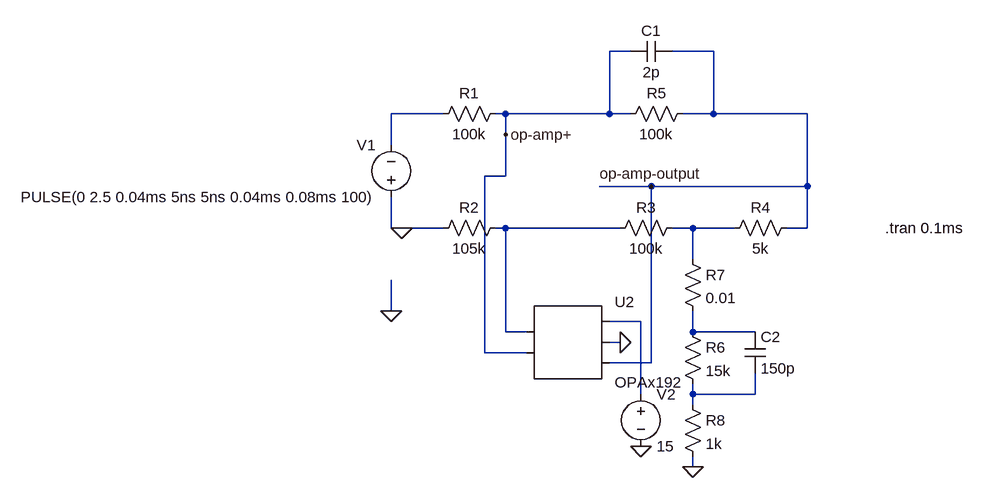
[diagram p0: schematic howland current pump.asc]
howland current pump.asc, the LTspice schematic file:
Version 4
SHEET 1 1072 864
WIRE 448 160 416 160
WIRE 576 160 512 160
WIRE 160 256 80 256
WIRE 256 256 240 256
WIRE 416 256 416 160
WIRE 416 256 256 256
WIRE 448 256 416 256
WIRE 576 256 576 160
WIRE 576 256 528 256
WIRE 720 256 576 256
WIRE 256 288 256 256
WIRE 80 304 80 256
WIRE 256 352 256 288
WIRE 256 352 224 352
WIRE 480 368 400 368
WIRE 720 368 720 256
WIRE 720 368 480 368
WIRE 80 432 80 384
WIRE 96 432 80 432
WIRE 160 432 96 432
WIRE 256 432 240 432
WIRE 432 432 256 432
WIRE 544 432 512 432
WIRE 608 432 544 432
WIRE 720 432 720 368
WIRE 720 432 688 432
WIRE 544 480 544 432
WIRE 80 560 80 512
WIRE 464 576 416 576
WIRE 256 592 256 432
WIRE 288 592 256 592
WIRE 544 592 544 560
WIRE 640 592 544 592
WIRE 432 608 416 608
WIRE 224 624 224 352
WIRE 288 624 224 624
WIRE 480 640 480 368
WIRE 480 640 416 640
WIRE 464 688 464 576
WIRE 544 688 544 672
WIRE 640 688 640 656
WIRE 640 688 544 688
WIRE 544 704 544 688
WIRE 544 800 544 784
FLAG 80 560 0
FLAG 464 768 0
FLAG 256 288 op-amp+
FLAG 480 368 op-amp-output
FLAG 432 608 0
FLAG 544 800 0
FLAG 96 432 0
SYMBOL Res 256 240 R90
WINDOW 0 0 56 VBottom 2
WINDOW 3 32 56 VTop 2
SYMATTR InstName R1
SYMATTR Value 100k
SYMBOL Res 256 416 R90
WINDOW 0 0 56 VBottom 2
WINDOW 3 32 56 VTop 2
SYMATTR InstName R2
SYMATTR Value 105k
SYMBOL Res 528 416 R90
WINDOW 0 0 56 VBottom 2
WINDOW 3 32 56 VTop 2
SYMATTR InstName R3
SYMATTR Value 100k
SYMBOL Res 704 416 R90
WINDOW 0 0 56 VBottom 2
WINDOW 3 32 56 VTop 2
SYMATTR InstName R4
SYMATTR Value 5k
SYMBOL Res 544 240 R90
WINDOW 0 0 56 VBottom 2
WINDOW 3 32 56 VTop 2
SYMATTR InstName R5
SYMATTR Value 100k
SYMBOL Cap 512 144 R90
WINDOW 0 0 32 VBottom 2
WINDOW 3 32 32 VTop 2
SYMATTR InstName C1
SYMATTR Value 2p
SYMBOL Res 528 576 R0
SYMATTR InstName R6
SYMATTR Value 15k
SYMBOL Cap 624 592 R0
SYMATTR InstName C2
SYMATTR Value 150p
SYMBOL Voltage 464 672 R0
SYMATTR InstName V2
SYMATTR Value 15
SYMATTR SpiceLine Rser=0
SYMBOL Res 528 464 R0
SYMATTR InstName R7
SYMATTR Value 0.01
SYMBOL AutoGenerated/OPAx192 352 608 R0
SYMATTR InstName U2
SYMBOL Voltage 80 400 R180
WINDOW 0 24 96 Left 2
WINDOW 3 24 16 Left 2
SYMATTR InstName V1
SYMATTR Value PULSE(0 2.5 0.04ms 5ns 5ns 0.04ms 0.08ms 100)
SYMATTR Value2 AC 1
SYMATTR SpiceLine Rser=0
SYMBOL Res 528 688 R0
SYMATTR InstName R8
SYMATTR Value 1k
TEXT 840 432 Left 2 !.tran 0.1ms

The netlist it stands for:
* howland current pump.asc
R1 op-amp+ N001 100k
R2 N002 0 105k
R3 N003 N002 100k
R4 op-amp-output N003 5k
R5 op-amp-output op-amp+ 100k
C1 op-amp-output op-amp+ 2p
R6 N005 N006 15k
C2 N005 N006 150p
V2 N004 0 15 Rser=0
R7 N003 N005 0.01
* U2: OPAx192 (symbol AutoGenerated/OPAx192 not available, pins judged from their places): pin1=N002 pin2=op-amp+ pin3=N004 pin4=0 pin5=op-amp-output
V1 0 N001 PULSE(0 2.5 0.04ms 5ns 5ns 0.04ms 0.08ms 100) AC 1 Rser=0
R8 N006 0 1k
.tran 0.1ms
.backanno
.end